# Altium project SMPS-12V_Board_Prj.PrjPcb
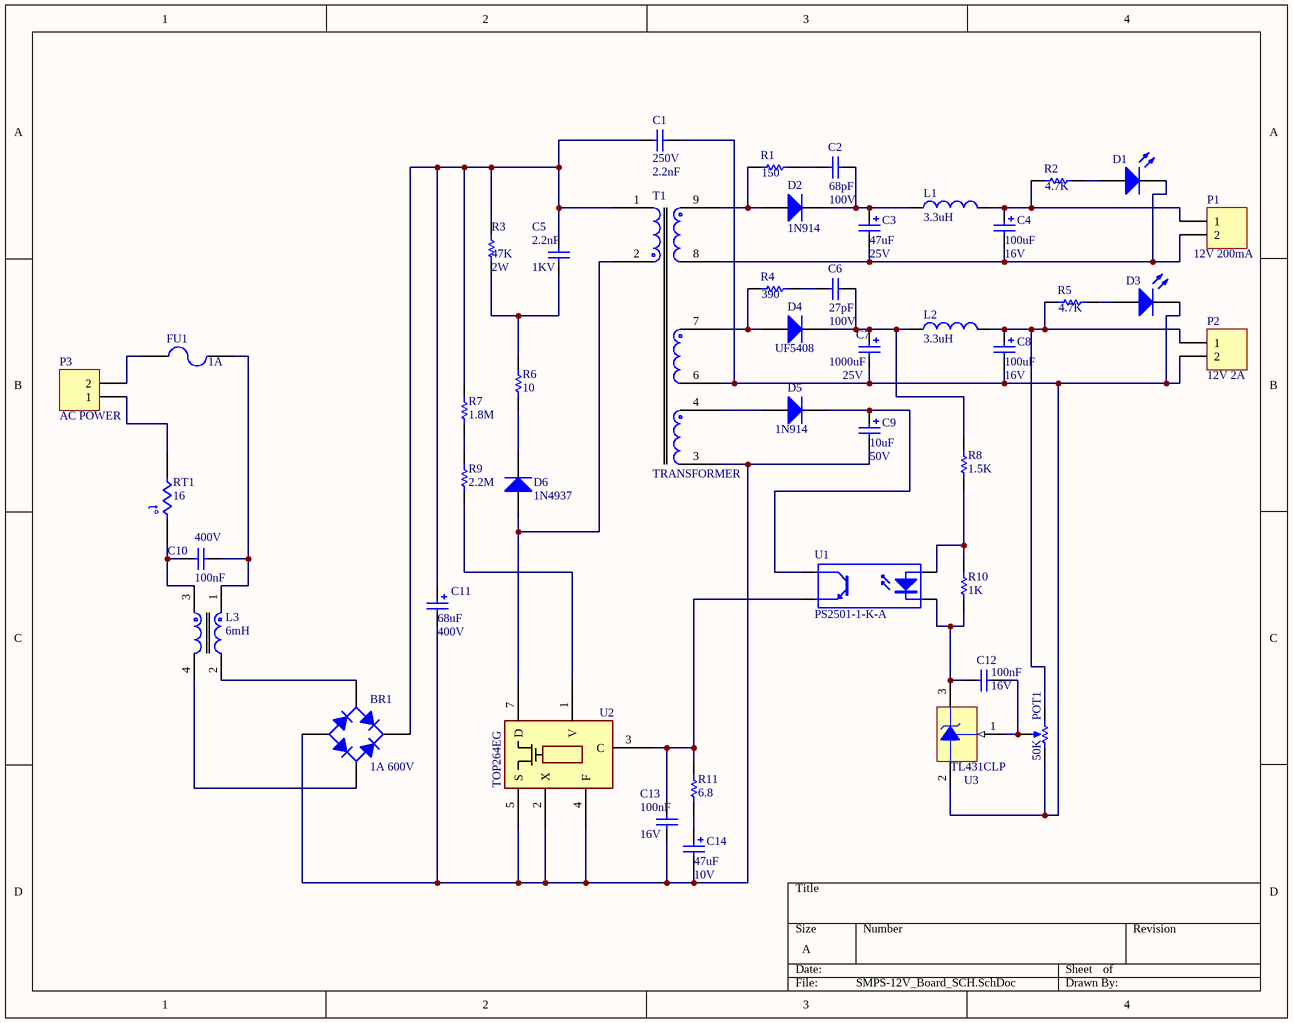
[diagram p0: SMPS-12V_Board_SCH.SchDoc]
1 sheet, 45 parts. Net scope: global (net labels, ports and power ports of the same name join across sheets).
Board file: SMPS-12V_Board_PCB.PcbDoc

## Sheet SMPS-12V_Board_SCH.SchDoc
size A; SheetNumber: 1; SheetTotal: 1

### Parts
BR1  1A 600V  [BRIDGE_DIODE_2A]
C1  250V  value 2.2nF  [CAP_2KV_DIP]
C2  100V  value 68pF  [CAP_UNPOLAR_DIP]
C3  25V  value 47uF  [CAP_47UF_25V]
C4  16V  value 100uF  [C_100UF_25V]
C5  1KV  value 2.2nF  [CAP_2KV_DIP]
C6  100V  value 27pF  [CAP_UNPOLAR_DIP]
C7  25V  value 1000uF  [CAP_1000UF_25V]
C8  16V  value 100uF  [C_100UF_25V]
C9  50V  value 10uF  [C_100UF_25V]
C10  400V  value 100nF  [CAP_100NF_400V]
C11  400V  value 68uF  [CAP_68UF_420V]
C12  16V  value 100nF  [CAP_UNPOLAR_DIP]
C13  16V  value 100nF  [CAP_UNPOLAR_DIP]
C14  10V  value 47uF  [CAP_47UF_25V]
D1  LED0  [LED_3M]  (value not drawn)
D2  1N914  [1N914]
D3  LED0  [LED_3M]  (value not drawn)
D4  UF5408  [1N5408]
D5  1N914  [1N914]
D6  1N4937  [1N4937]
FU1  1A  [FUSE_HOLDER]
L1  value 3.3uH  [L_500MA]  (hidden comment: Inductor)
L2  value 3.3uH  [L_3A]  (hidden comment: Inductor)
L3  6mH  [LINE_FILTER_MINI]
P1  12V 200mA  [POWER_CON_2]
P2  12V 2A  [POWER_CON_2]
P3  AC POWER  [POWER_CON220_2]
POT1  value 50K  [POT]  (hidden comment: RPot)
R1  value 150  [RES_DIP_3]
R2  value 4.7K  [RES_DIP_3]
R3  2W  value 47K  [RES_47K_2W]
R4  value 390  [RES_DIP_3]
R5  value 4.7K  [RES_DIP_3]
R6  value 10  [RES_DIP_3]  (hidden comment: Res1)
R7  value 1.8M  [RES_DIP_3]  (hidden comment: Res1)
R8  value 1.5K  [RES_DIP_3]  (hidden comment: Res1)
R9  value 2.2M  [RES_DIP_3]  (hidden comment: Res1)
R10  value 1K  [RES_DIP_3]  (hidden comment: Res1)
R11  value 6.8  [RES_DIP_3]  (hidden comment: Res1)
RT1  16  [VDR_10]
T1  TRANSFORMER  [Transformer]
U1  PS2501-1-K-A  [PC817_DIP]
U2  TOP264EG  [TOP264E]
U3  TL431CLP  [TL431A]

### Nets
NetBR1_1: BR1.1(K) C1.2 C5.2 C11.1 R3.2 R7.2 T1.1
NetBR1_2: BR1.2(C) L3.4
NetBR1_3: BR1.3(A) C9.2 C11.2 C13.1 C14.2 T1.3 U2.2(X) U2.4(F) U2.5(S)
NetBR1_4: BR1.4(C) L3.2
NetC1_1: C1.1 C7.2 C8.2 D3.2(K) P2.2 POT1.2(BOT) T1.6 U3.2(A)
NetC2_1: C2.1 C3.1 D2.2(K) L1.1
NetC2_2: C2.2 R1.1
NetC3_2: C3.2 C4.2 D1.2(K) P1.2 T1.8
NetC4_1: C4.1 L1.2 P1.1 R2.2
NetC5_1: C5.1 R3.1 R6.2
NetC6_1: C6.1 C7.1 D4.2(K) L2.1 R8.2
NetC6_2: C6.2 R4.1
NetC8_1: C8.1 L2.2 P2.1 POT1.1(TOP) R5.2
NetC9_1: C9.1 D5.2(K) U1.4(C)
NetC10_1: C10.1 FU1.2 L3.1
NetC10_2: C10.2 L3.3 RT1.1
NetC12_1: C12.1 POT1.3(TAP) U3.1(REF)
NetC12_2: C12.2 R10.1 U1.2(K) U3.3(K)
NetC13_2: C13.2 R11.2 U1.3(E) U2.3(C)
NetC14_1: C14.1 R11.1
NetD1_1: D1.1(A) R2.1
NetD2_1: D2.1(A) R1.2 T1.9
NetD3_1: D3.1(A) R5.1
NetD4_1: D4.1(A) R4.2 T1.7
NetD5_1: D5.1(A) T1.4
NetD6_1: D6.1(A) T1.2 U2.7(D)
NetD6_2: D6.2(K) R6.1
NetFU1_1: FU1.1 P3.2
NetP3_1: P3.1 RT1.2
NetR7_1: R7.1 R9.2
NetR8_1: R8.1 R10.2 U1.1(A)
NetR9_1: R9.1 U2.1(V)

### Notes on the sheet
- (in symbol Res Thermal) t°

### Library data of the parts
BR1 = Bridge1: Full Wave Diode Bridge; Published: 8-Jun-2000; LatestRevisionDate: 29-May-2009; LatestRevisionNote: Sch pins A & K swapped.; DatasheetVersion: E2732B; PackageReference: D-38; Publisher: Altium Limited
C1 C2 C5 C6 C10 C12 C13 = Cap: Capacitor; Published: 8-Jun-2000; LatestRevisionDate: 17-Jul-2002; LatestRevisionNote: Re-released for DXP Platform.; PackageReference: RAD-0.3; Publisher: Altium Limited
C3 C4 C7-C9 C11 C14 = Cap Pol2: Polarized Capacitor (Axial); Published: 8-Jun-2000; LatestRevisionDate: 17-Jul-2002; LatestRevisionNote: Re-released for DXP Platform.; PackageReference: POLAR0.8; Publisher: Altium Limited
D1 D3 = LED0: Typical INFRARED GaAs LED; Published: 8-Jun-2000; LatestRevisionDate: 08-Jul-2005; LatestRevisionNote: Mech Layer 1 removed.; PackageReference: LED-0; Publisher: Altium Limited
D2 D4 D5 = Diode 1N914: High Conductance Fast Diode; Published: 8-Jun-2000; LatestRevisionDate: 17-Jul-2002; LatestRevisionNote: Re-released for DXP Platform.; DatasheetVersion: 1997; PackageReference: DO-35; Publisher: Altium Limited; Code_JEDEC: DO-204-AH; ComponentLink1Description: Manufacturer Link; ComponentLink1URL: http://www.fairchildsemi.com/; ComponentLink2Description: Datasheet; ComponentLink2URL: http://www.fairchildsemi.com/ds/1N%2F1N4448.pdf
D6 = Diode 1N4934: 1 Amp Fast Recovery Rectifier; Published: 8-Jun-2000; LatestRevisionDate: 17-Jul-2002; LatestRevisionNote: Re-released for DXP Platform.; DatasheetVersion: 1999; PackageVersion: Aug-1999; PackageReference: DO-41; Publisher: Altium Limited; Code_JEDEC: DO-204-AL; ComponentLink1Description: Manufacturer Link; ComponentLink1URL: http://www.fairchildsemi.com/; ComponentLink2Description: Datasheet; ComponentLink2URL: http://www.fairchildsemi.com/ds/1N%2F1N4934.pdf
FU1 = Fuse 2: Fuse; Published: 8-Jun-2000; LatestRevisionDate: 17-Jul-2002; LatestRevisionNote: Re-released for DXP Platform.; PackageReference: PIN-W2/E2.8; Publisher: Altium Limited
L1 L2 = Inductor: Code_IEC: 1005; Published: 8-Jun-2000; LatestRevisionDate: 29-May-2009; LatestRevisionNote: IPC-7351 Footprint Added.; PackageReference: 0402-A; Publisher: Altium Limited; PackageDescription: Chip Inductor; Code_JEITA: 0402
L3 = LINE_FILTER
P1-P3 = Header 2: Header, 2-Pin; LatestRevisionDate: 17-Jul-2002; LatestRevisionNote: Re-released for DXP Platform.; Publisher: Altium Limited
POT1 = RPot: Potentiometer; Sim Note: Enter the Resistance value and the set point into parameter fields.; Set Position: 0.5; Published: 8-Jun-2000; LatestRevisionDate: 17-Jul-2002; LatestRevisionNote: Re-released for DXP Platform.; PackageReference: VR5; Publisher: Altium Limited
R1-R11 = Res1: Resistor; Published: 8-Jun-2000; LatestRevisionDate: 17-Jul-2002; LatestRevisionNote: Re-released for DXP Platform.; PackageReference: AXIAL-0.3; Publisher: Altium Limited
RT1 = Res Thermal: Thermistor; Published: 24-Mar-1999; LatestRevisionDate: 29-May-2009; LatestRevisionNote: IPC-7351 Footprint Added.; PackageVersion: Mar-2003; PackageReference: 6-0805; Publisher: Altium Limited; PackageDescription: Chip Resistor 0805 Case Size; Code_IPC: RESC2012
U1 = Optoisolator1: 4-Pin Phototransistor Optocoupler; Published: 24-Mar-1999; LatestRevisionDate: 04-Mar-2005; LatestRevisionNote: Sch pins 3 & 4 Swapped.; DatasheetVersion: Nov-2003; PackageReference: DIP-4; Publisher: Altium Limited
U3 = TL431CLP: Programmable Precision Reference; Published: 15-Apr-2002; DatasheetVersion: 1999; PackageVersion: 1996; PackageReference: 29-04; Publisher: Altium Limited; PackageDescription: TO, Flat Index; 3 In-Line, Axial Leads; Body Dia. 4.8mm; Leads 0.48 x 0.51 mm (max); ComponentLink1Description: Manufacturer Link; ComponentLink1URL: http://www.onsemi.com/site/products/taxonomy/0,4438,503,00.html; ComponentLink2Description: Datasheet; ComponentLink2URL: http://www.onsemi.com/pub/Collateral/TL431-D.PDF